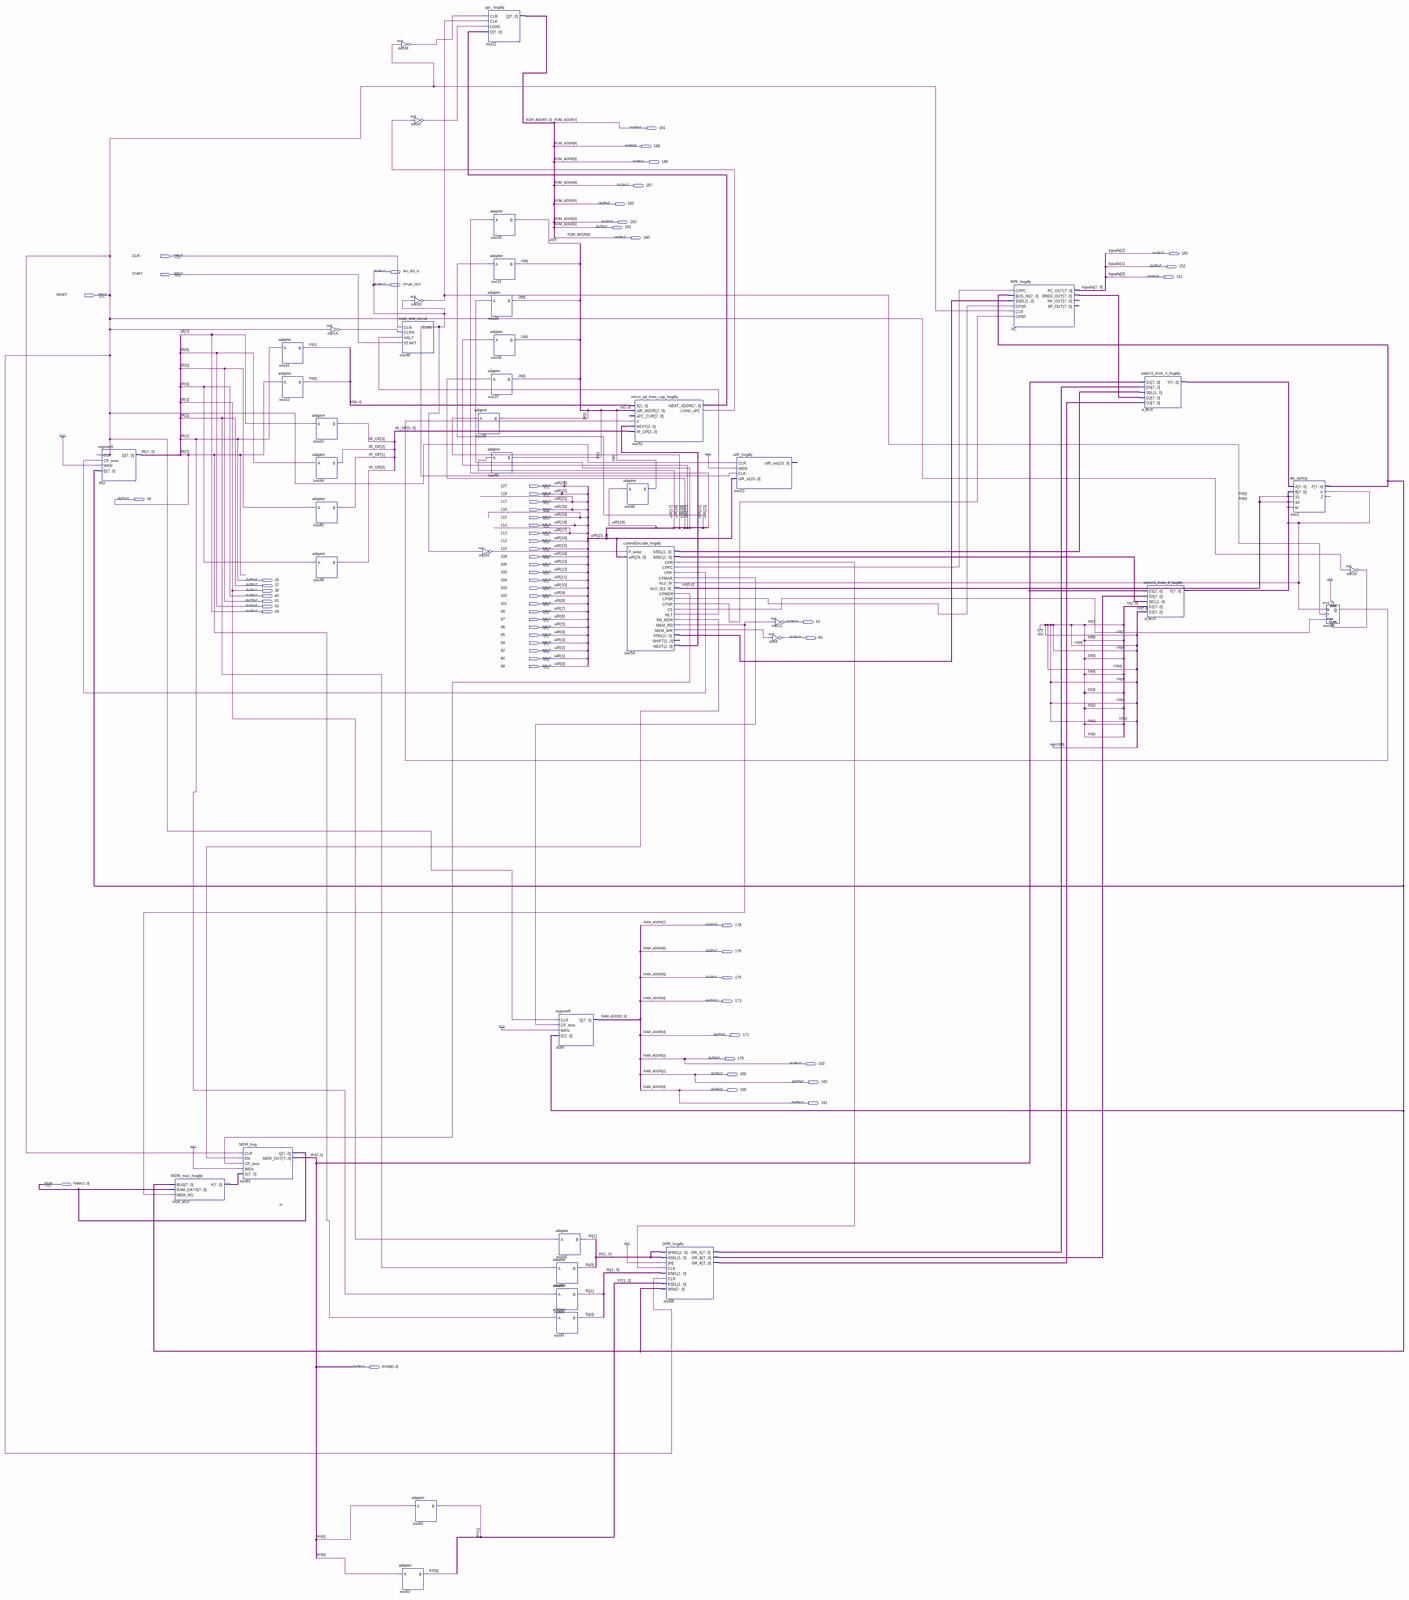
[diagram p0: schematic sheet, whole]
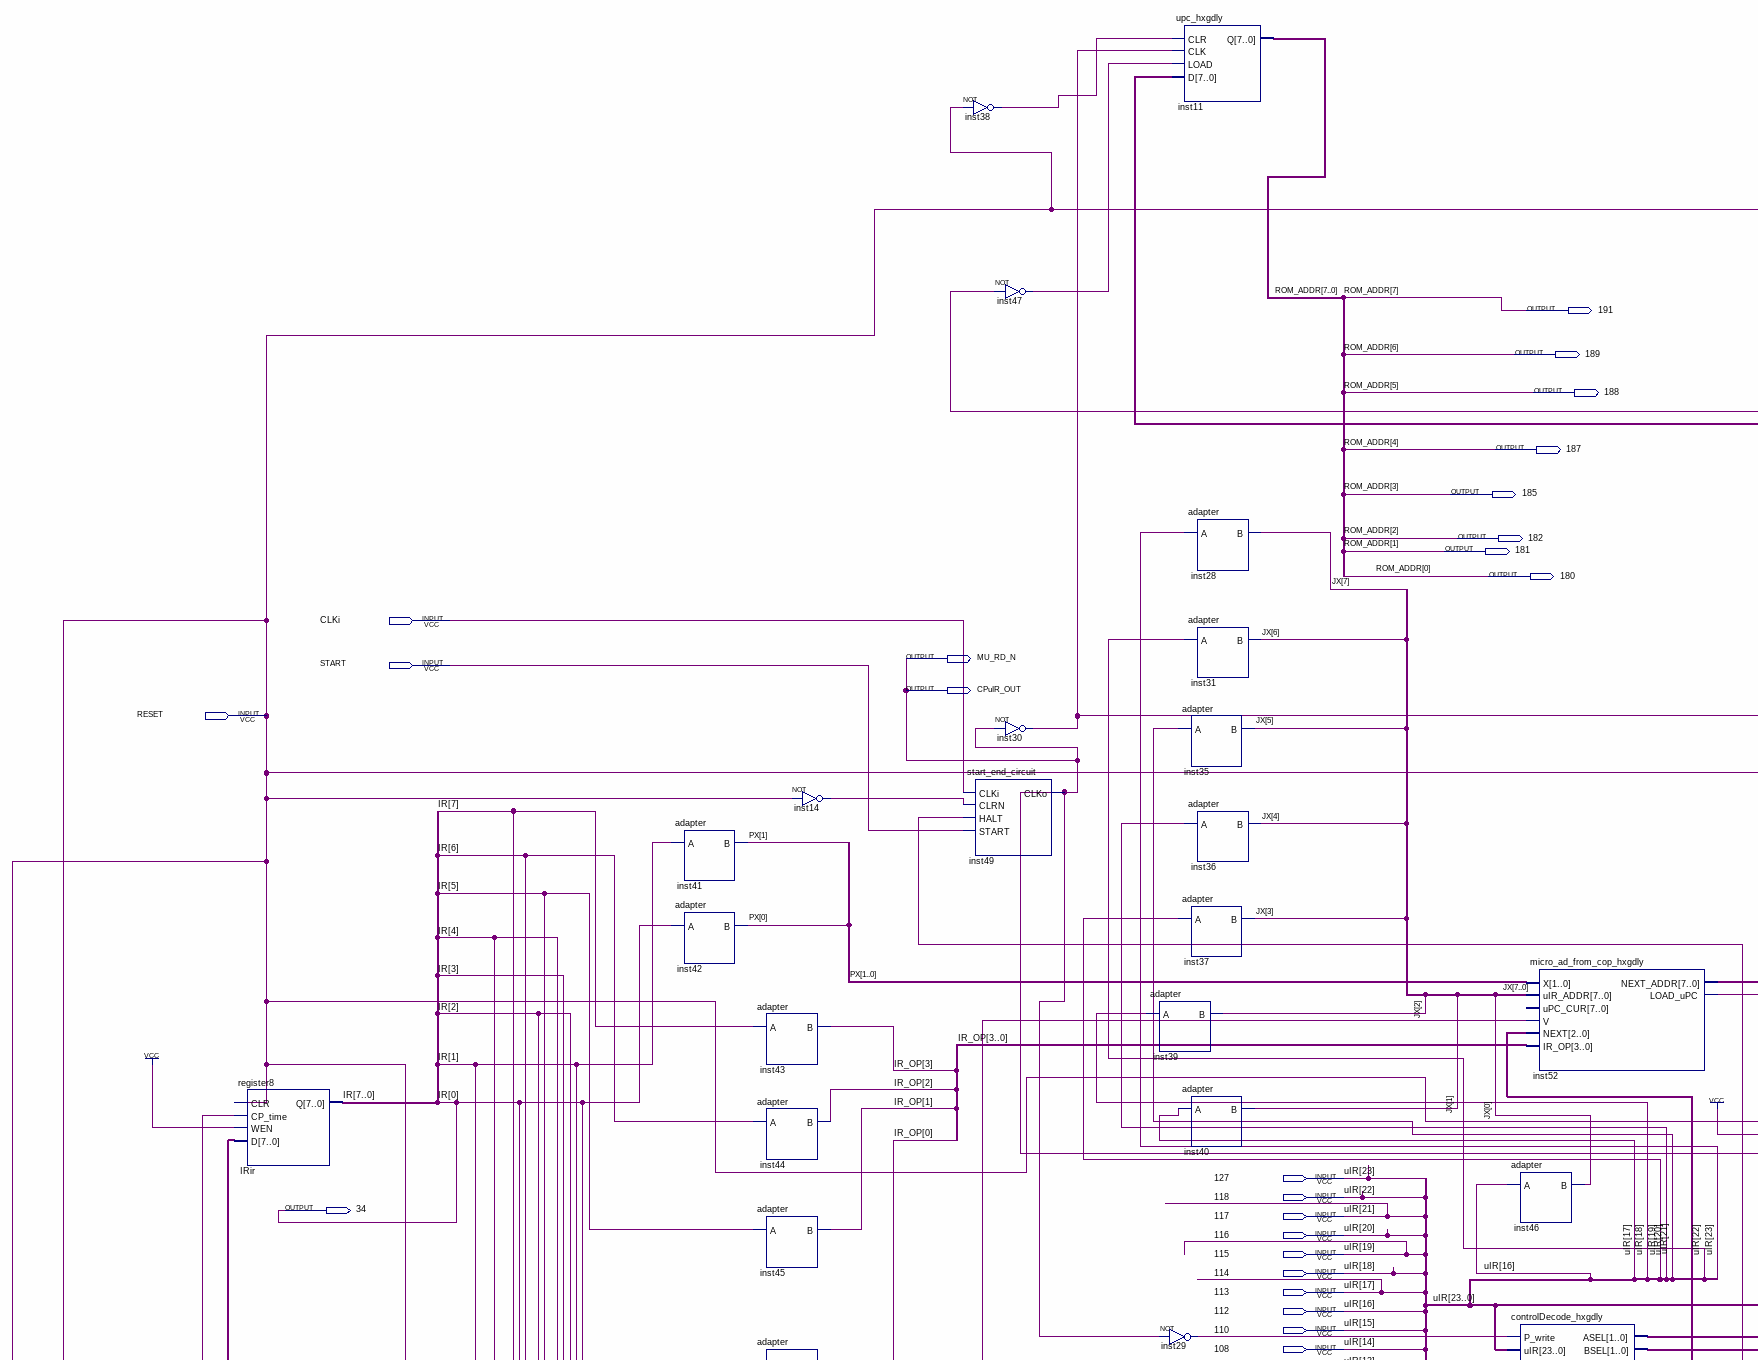
[diagram p1: schematic sheet, upper left part]
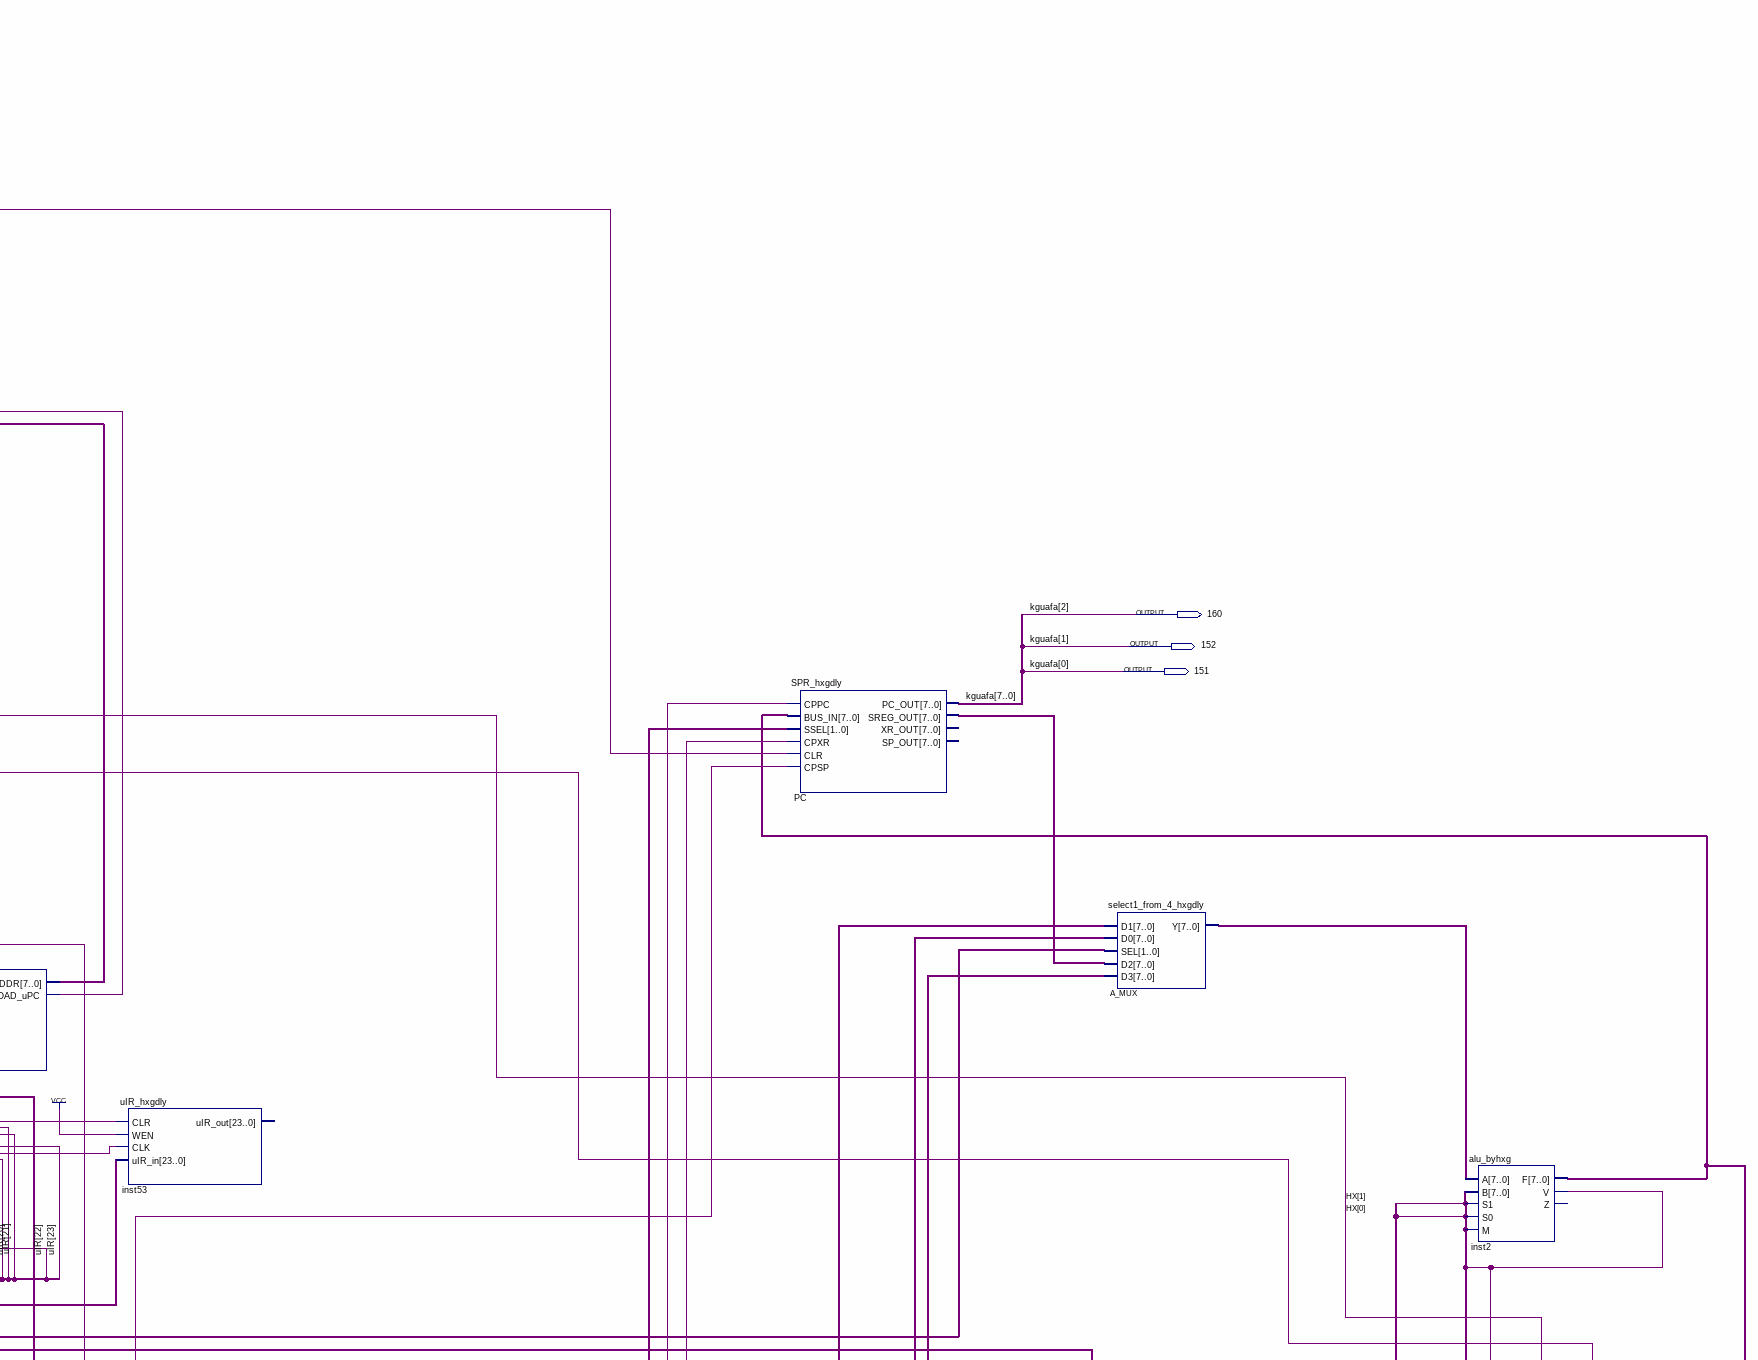
[diagram p2: schematic sheet, upper right part]
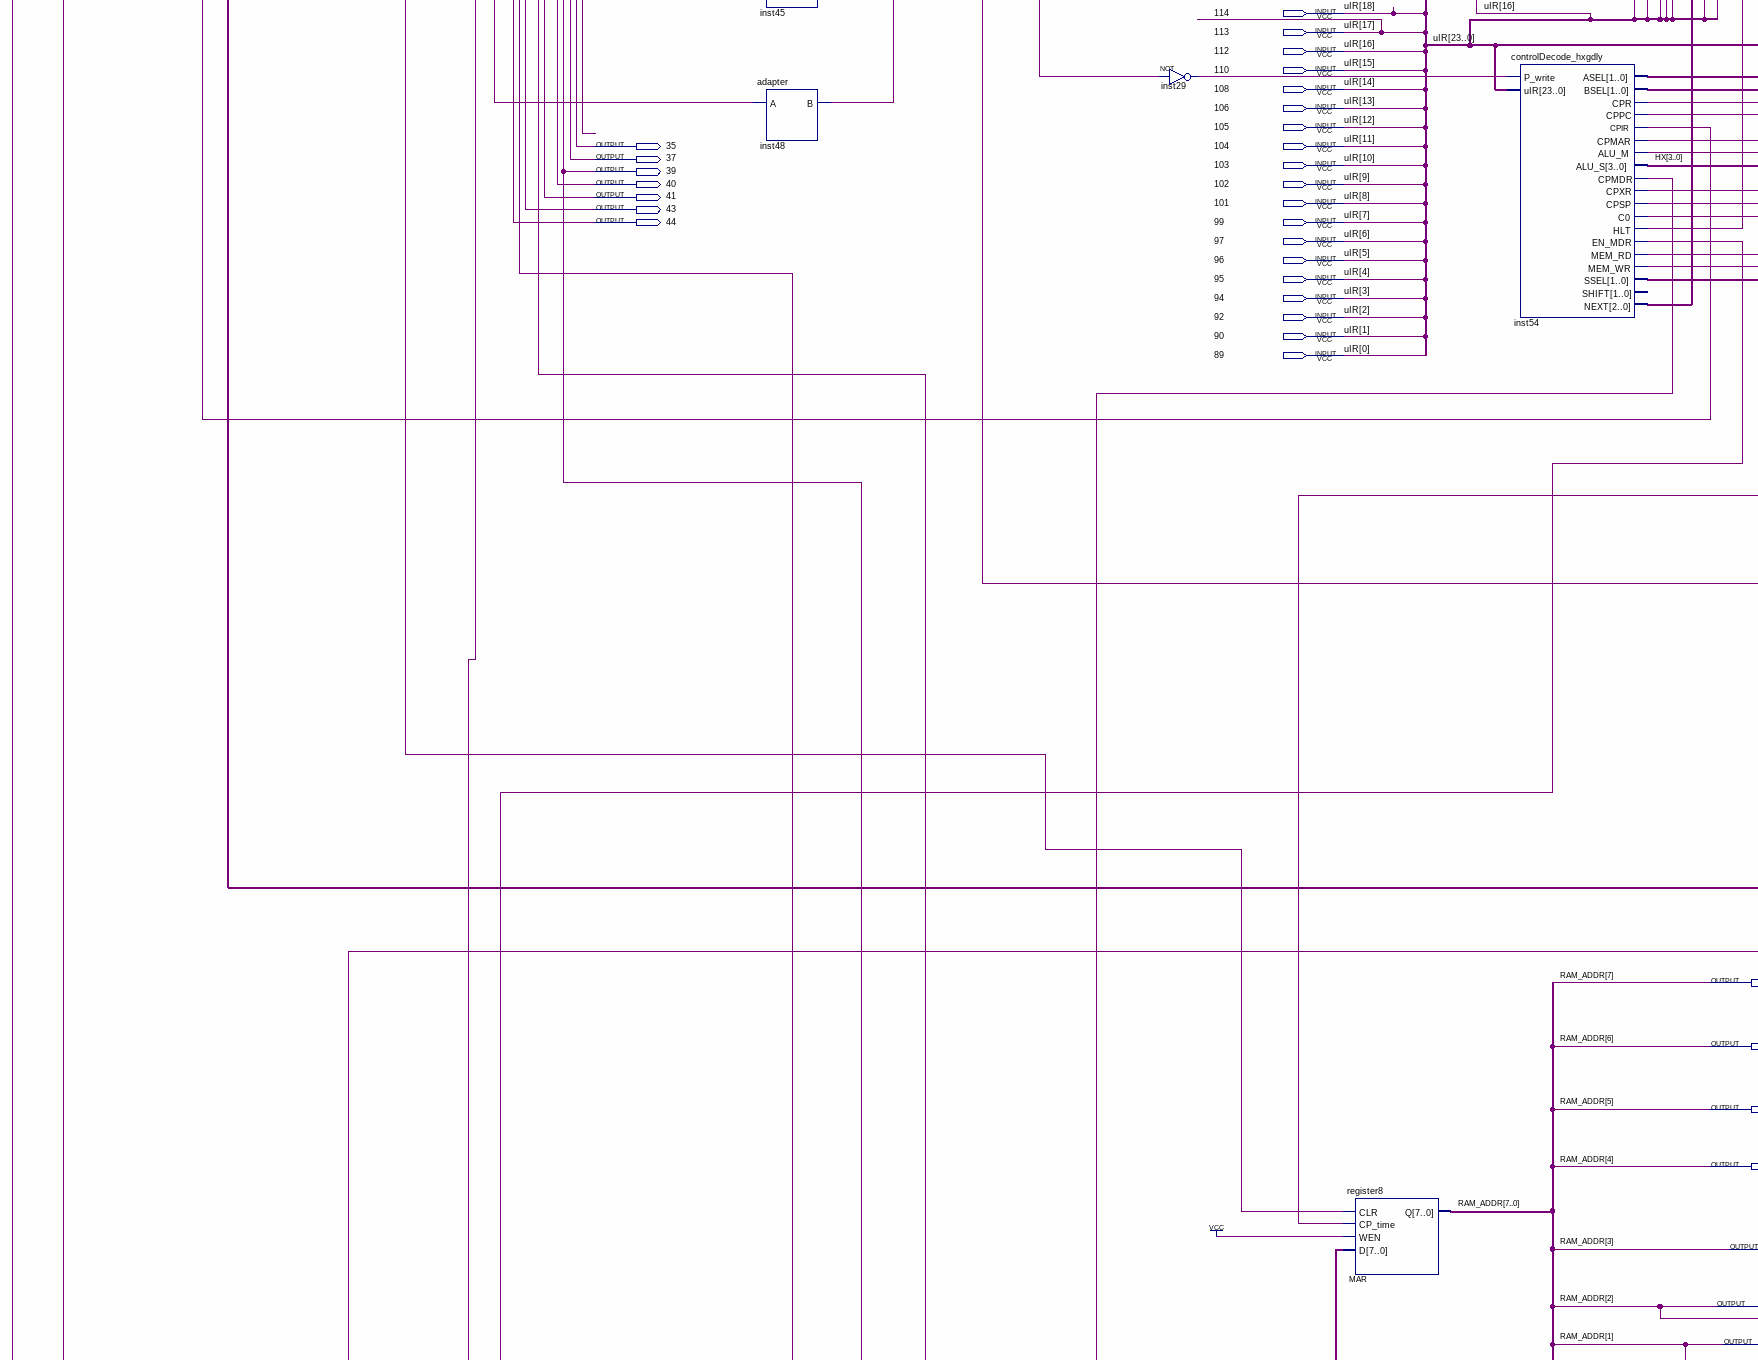
[diagram p3: schematic sheet, middle left part]
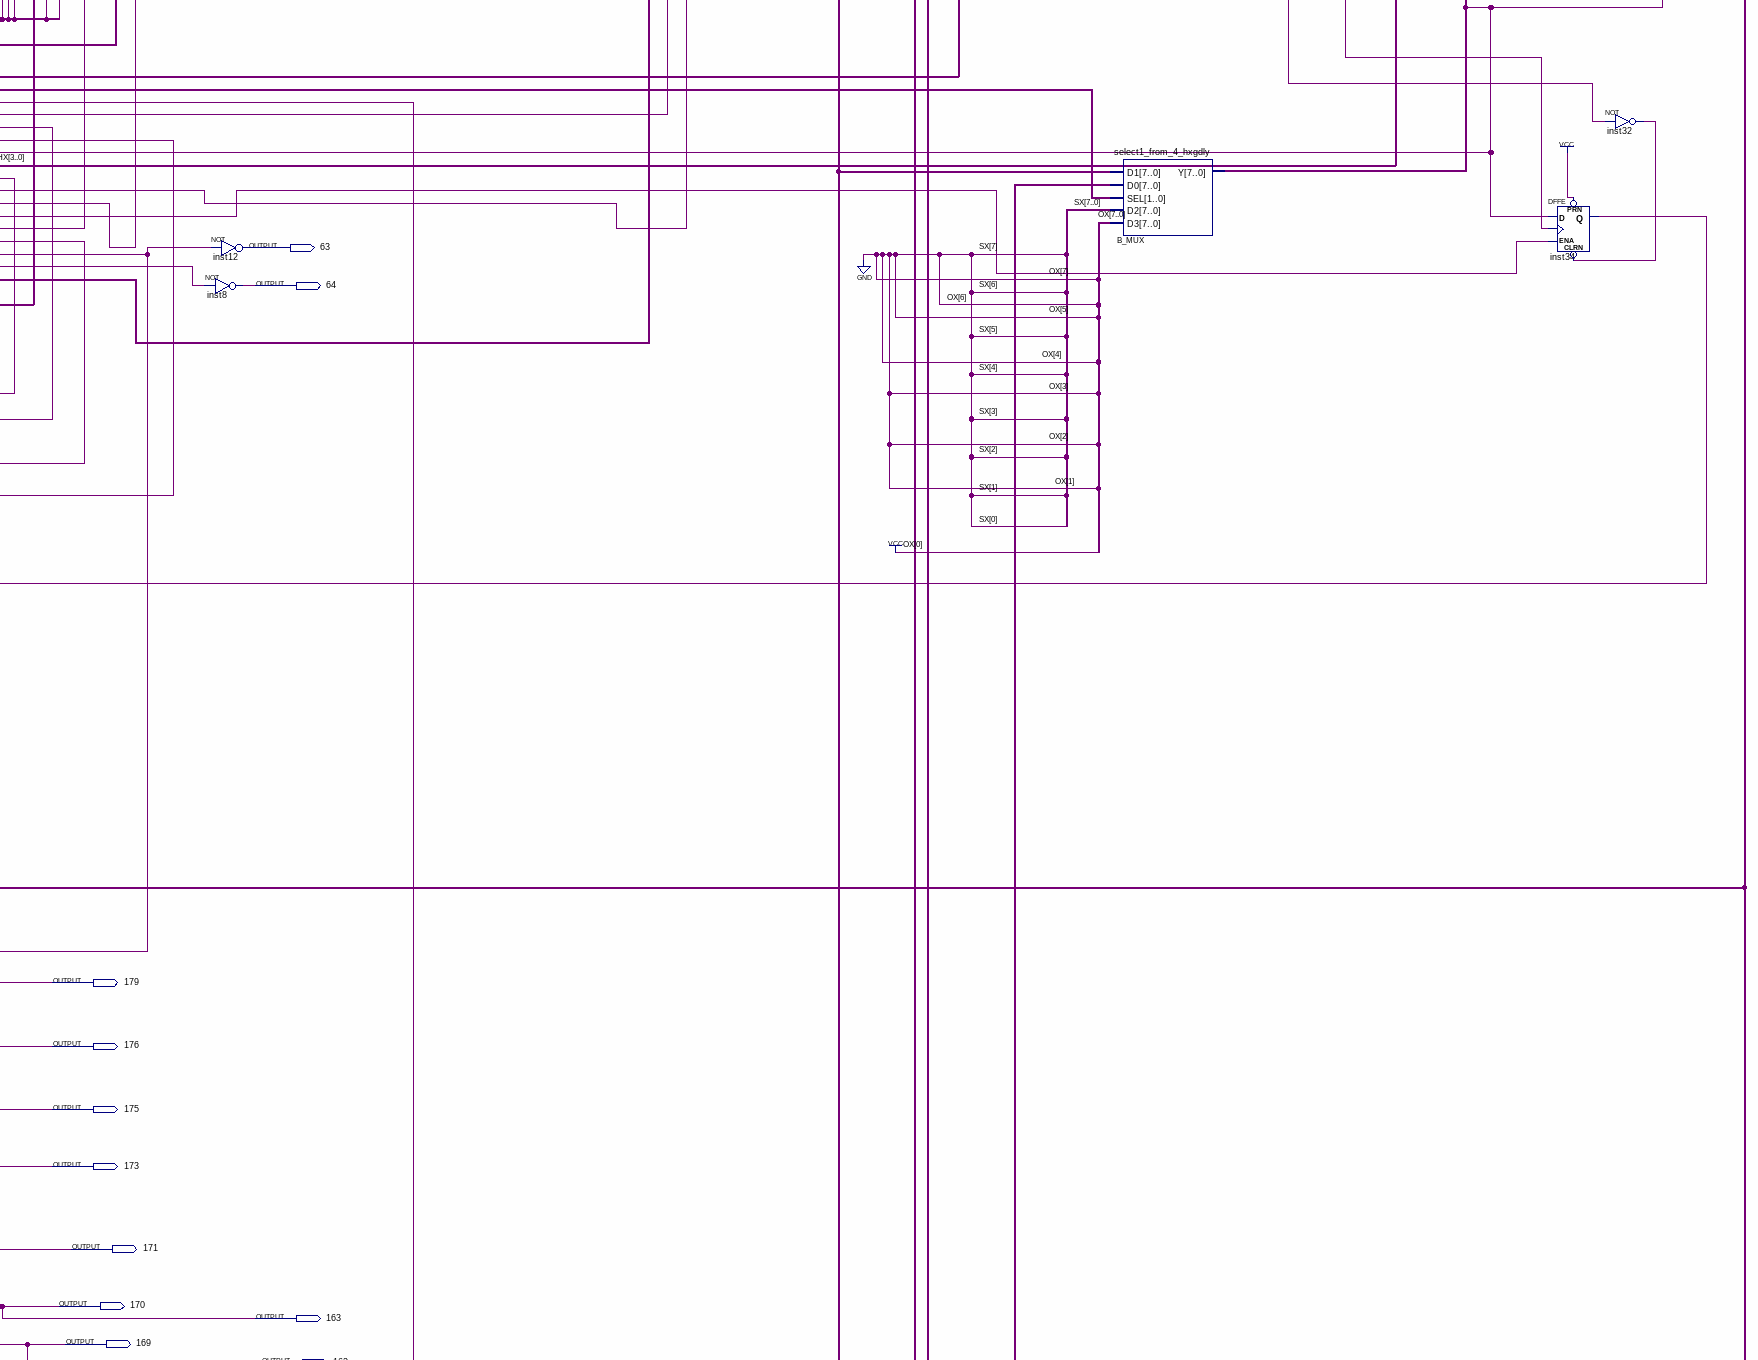
[diagram p4: schematic sheet, middle right part]
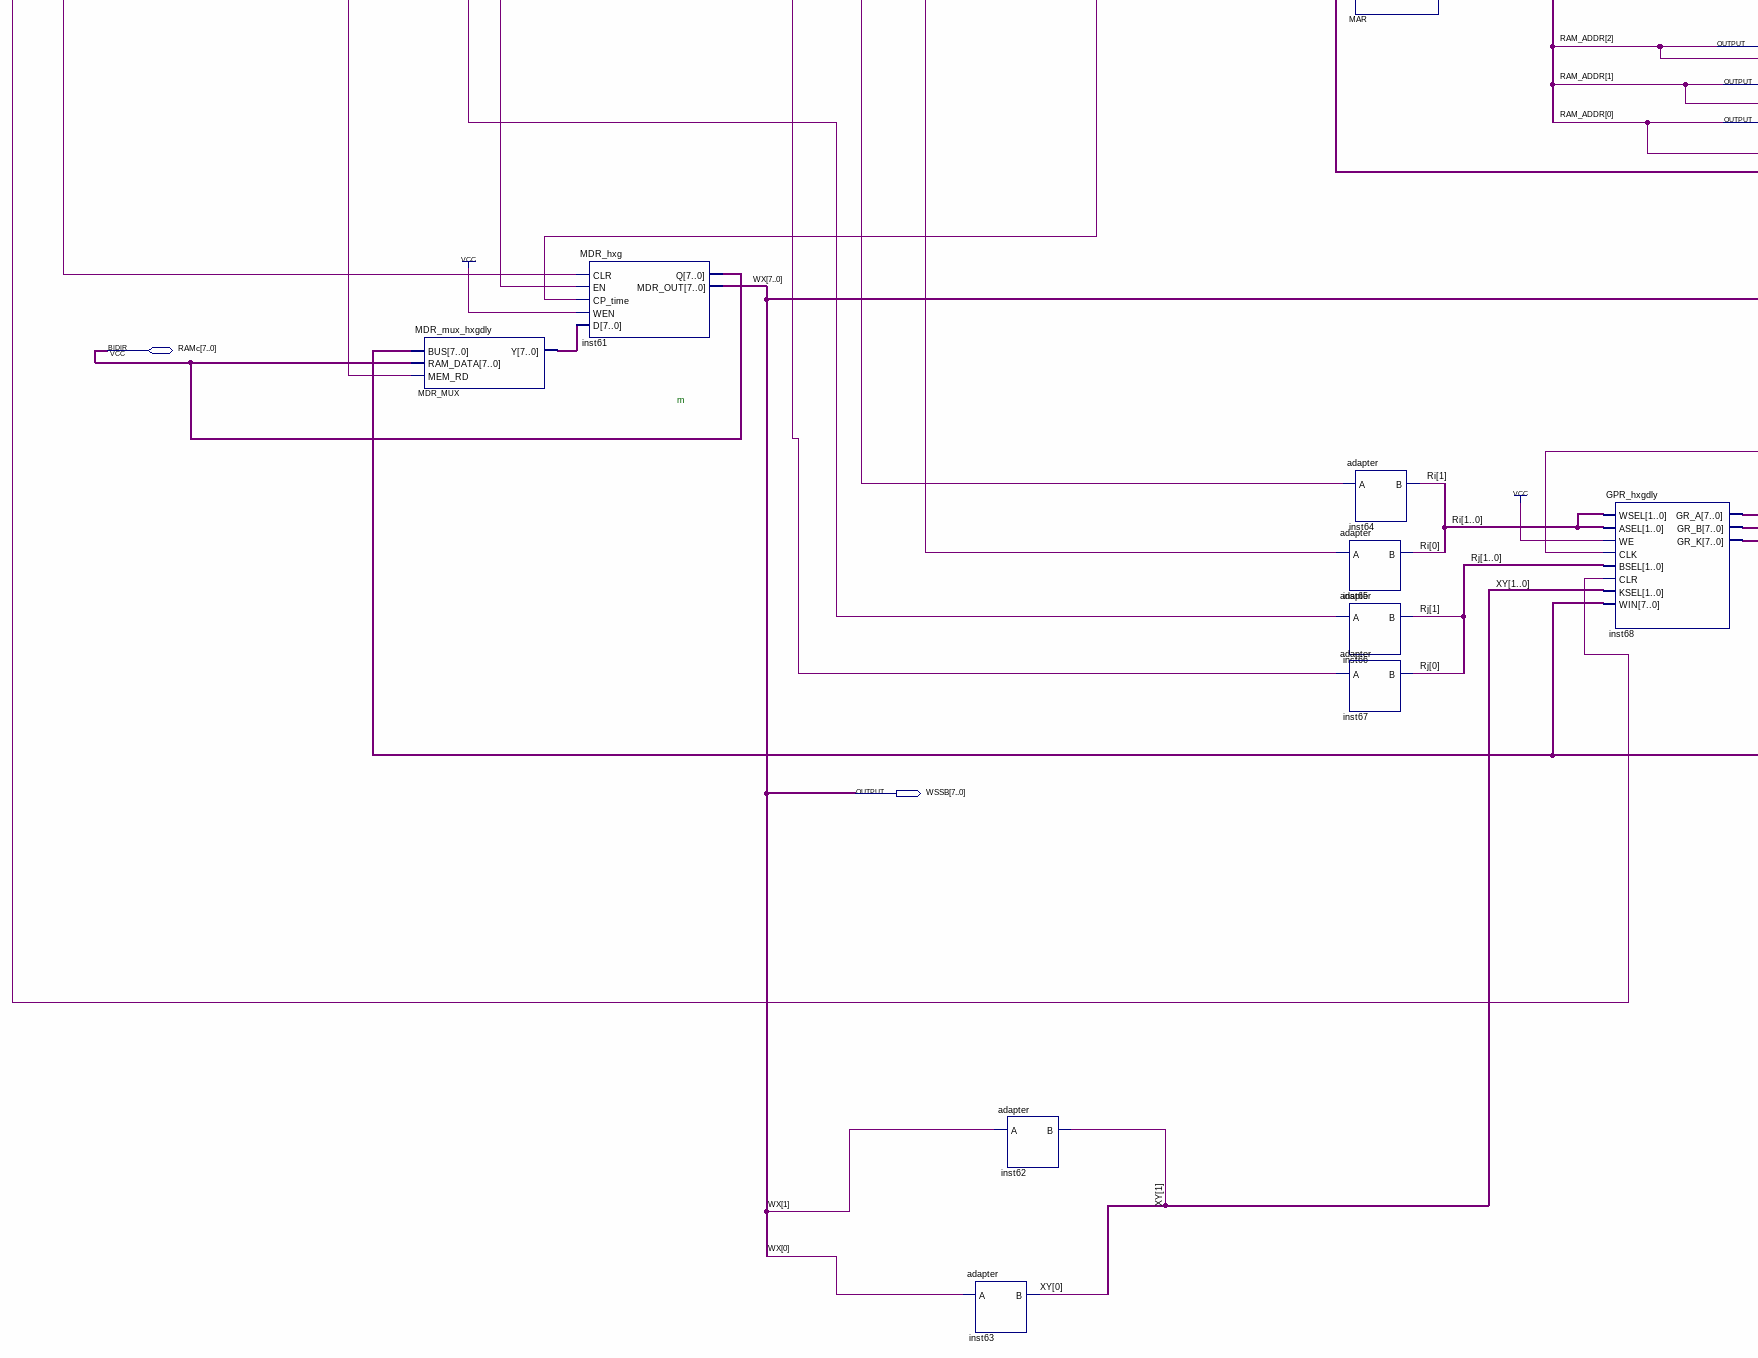
[diagram p5: schematic sheet, lower left part]
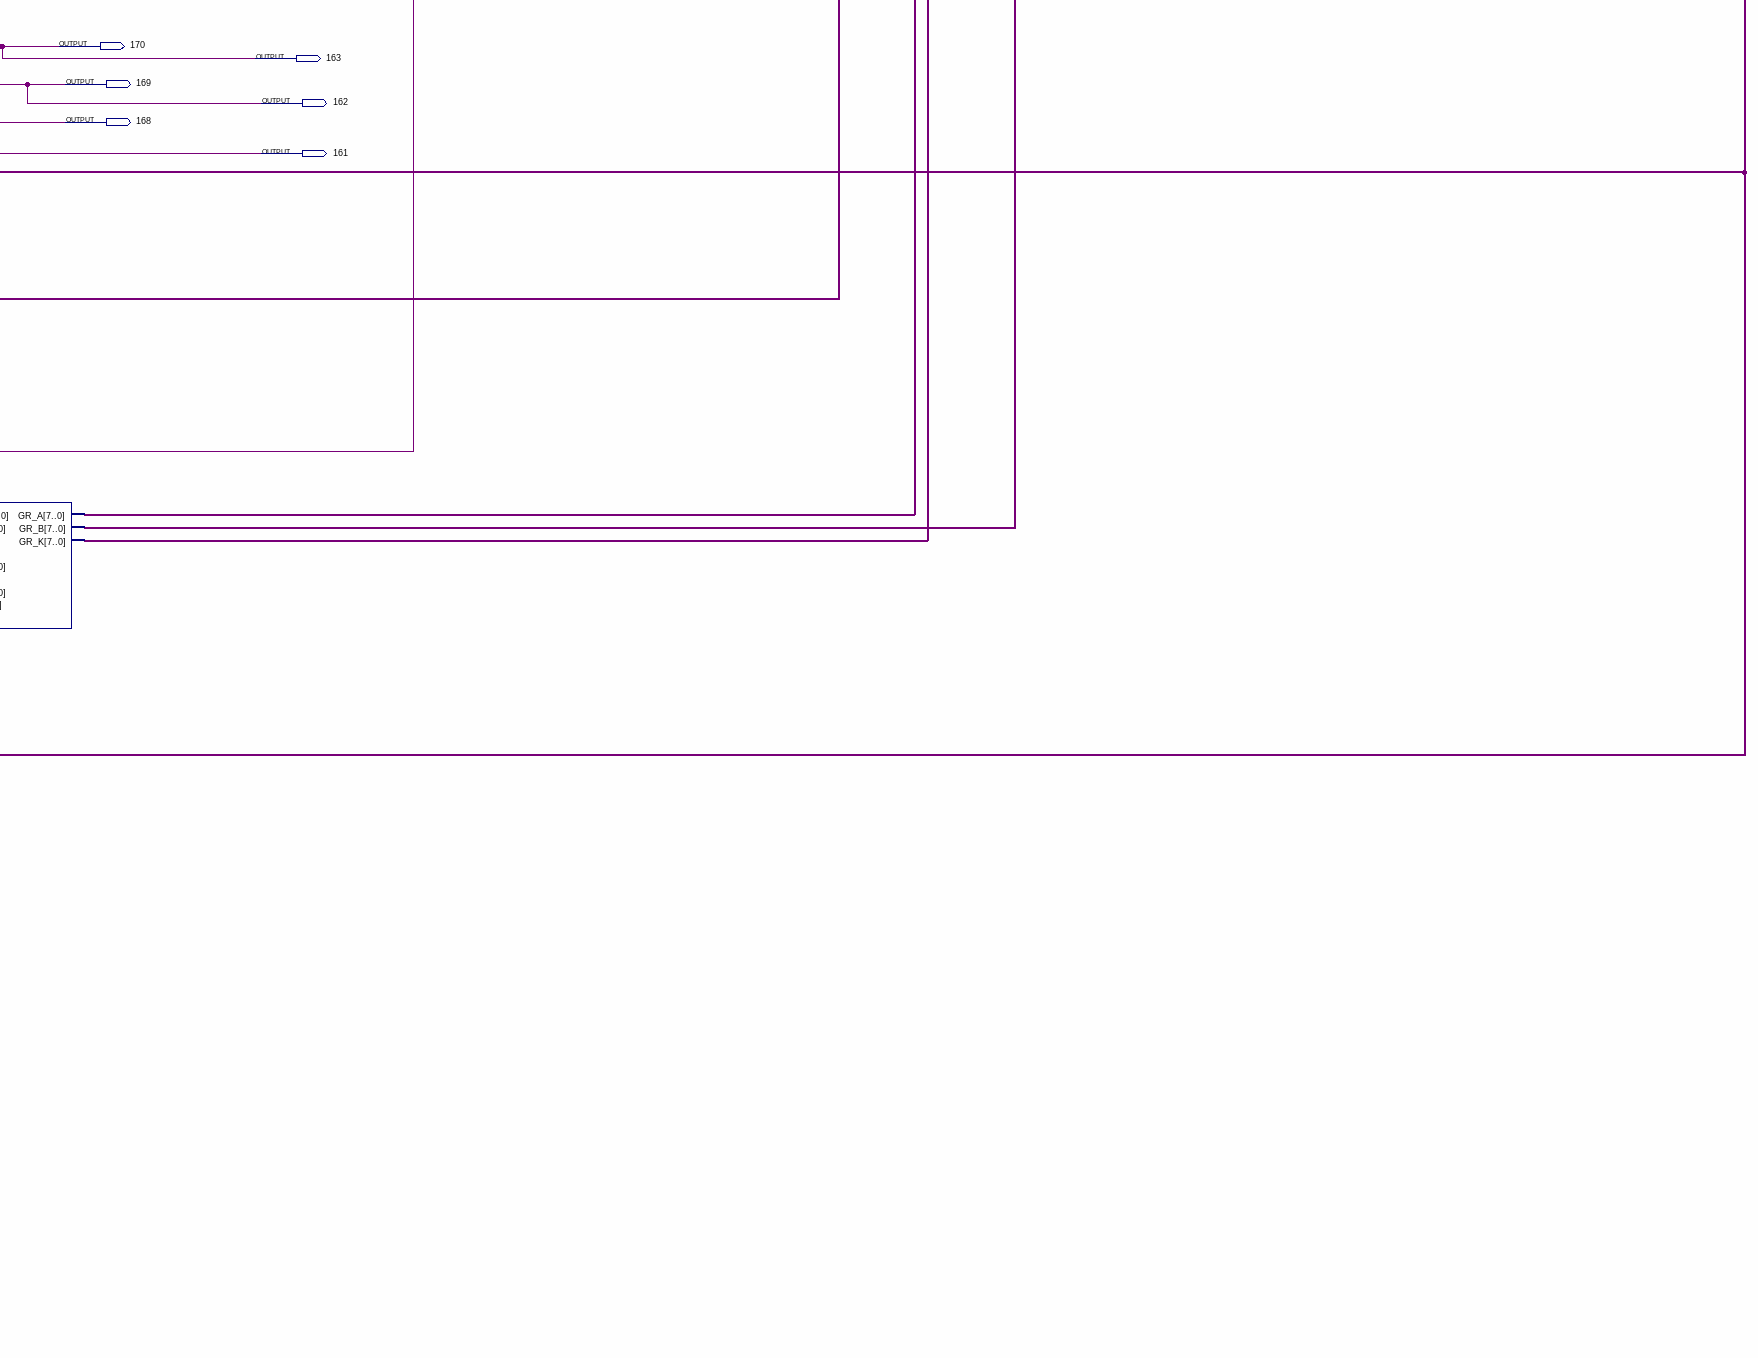
[diagram p6: schematic sheet, lower right part]
// Quartus schematic exp_final_hxgdly.bdf as structural Verilog: 43 symbols, 63 pins
module exp_final_hxgdly (
  input  CLKi,
  input  START,
  input  RESET,
  input  \127 ,
  input  \118 ,
  input  \117 ,
  input  \116 ,
  input  \115 ,
  input  \114 ,
  input  \113 ,
  input  \112 ,
  input  \110 ,
  input  \108 ,
  input  \106 ,
  input  \105 ,
  input  \104 ,
  input  \103 ,
  input  \102 ,
  input  \101 ,
  input  \99 ,
  input  \97 ,
  input  \96 ,
  input  \95 ,
  input  \94 ,
  input  \92 ,
  input  \90 ,
  input  \89 ,
  inout  [7:0] RAMc,
  output \191 ,
  output \189 ,
  output \188 ,
  output \187 ,
  output \185 ,
  output \182 ,
  output \181 ,
  output \180 ,
  output \160 ,
  output \152 ,
  output MU_RD_N,
  output \151 ,
  output CPuIR_OUT,
  output \34 ,
  output \35 ,
  output \37 ,
  output \39 ,
  output \40 ,
  output \41 ,
  output \43 ,
  output \44 ,
  output \63 ,
  output \64 ,
  output \179 ,
  output \176 ,
  output \175 ,
  output \173 ,
  output \171 ,
  output \170 ,
  output \163 ,
  output \169 ,
  output \162 ,
  output \168 ,
  output \161 ,
  output [7:0] WSSB
);

  wire inst14_out, inst29_out, inst30_out, inst32_out, inst34_q, inst38_out, inst47_out, inst52_load_upc,
       inst54_alu_m, inst54_c0, inst54_cpir, inst54_cpmar, inst54_cpmdr, inst54_cppc, inst54_cpr,
       inst54_cpsp, inst54_cpxr, inst54_en_mdr, inst54_hlt, inst54_mem_rd, inst54_mem_wr;
  wire [1:0] inst54_asel, inst54_bsel, inst54_ssel, PX, Ri, Rj, XY;
  wire [2:0] inst54_next;
  wire [3:0] HX, IR_OP;
  wire [7:0] A_MUX_y, B_MUX_y, inst2_f, inst52_next_addr, inst68_gr_a, inst68_gr_b, inst68_gr_k, JX,
       MDR_MUX_y, PC_sreg_out;
  wire [7:3] kguafa;

  register8 IRir (
    .CLR(RESET), .CP_time(inst54_cpir), .WEN(1'b1), .D(inst2_f),
    .Q({\44 , \43 , \41 , \40 , \39 , \37 , \35 , \34 }));
  MDR_mux_hxgdly MDR_MUX (.BUS(inst2_f), .RAM_DATA(RAMc), .MEM_RD(inst54_mem_rd), .Y(MDR_MUX_y));
  MDR_hxg inst61 (
    .CLR(RESET), .EN(inst54_en_mdr), .CP_time(inst54_cpmdr), .WEN(1'b1), .D(MDR_MUX_y), .Q(RAMc),
    .MDR_OUT(WSSB));
  adapter inst41 (.A(\35 ), .B(PX[1]));
  adapter inst42 (.A(\34 ), .B(PX[0]));
  adapter inst43 (.A(\44 ), .B(IR_OP[3]));
  adapter inst44 (.A(\43 ), .B(IR_OP[2]));
  adapter inst45 (.A(\41 ), .B(IR_OP[1]));
  adapter inst48 (.A(\40 ), .B(IR_OP[0]));
  not inst14 (inst14_out, RESET);
  not inst38 (inst38_out, RESET);
  start_end_circuit inst49 (.CLKi(CLKi), .CLRN(inst14_out), .HALT(inst54_hlt), .START(START), .CLKo(CPuIR_OUT));
  adapter inst63 (.A(WSSB[0]), .B(XY[0]));
  not inst47 (inst47_out, inst52_load_upc);
  not inst30 (inst30_out, CPuIR_OUT);
  adapter inst62 (.A(WSSB[1]), .B(XY[1]));
  upc_hxgdly inst11 (
    .CLR(inst38_out), .CLK(inst30_out), .LOAD(inst47_out), .D(inst52_next_addr),
    .Q({\191 , \189 , \188 , \187 , \185 , \182 , \181 , \180 }));
  adapter inst28 (.A(\127 ), .B(JX[7]));
  adapter inst31 (.A(\118 ), .B(JX[6]));
  adapter inst35 (.A(\117 ), .B(JX[5]));
  adapter inst36 (.A(\116 ), .B(JX[4]));
  adapter inst37 (.A(\115 ), .B(JX[3]));
  adapter inst39 (.A(\114 ), .B(JX[2]));
  adapter inst40 (.A(\113 ), .B(JX[1]));
  not inst29 (inst29_out, CPuIR_OUT);
  register8 MAR (
    .CLR(RESET), .CP_time(inst54_cpmar), .WEN(1'b1), .D(inst2_f),
    .Q({\179 , \176 , \175 , \173 , \171 , \163 , \162 , \161 }));
  adapter inst64 (.A(\39 ), .B(Ri[1]));
  adapter inst65 (.A(\37 ), .B(Ri[0]));
  adapter inst66 (.A(\35 ), .B(Rj[1]));
  adapter inst67 (.A(\34 ), .B(Rj[0]));
  micro_ad_from_cop_hxgdly inst52 (
    .X(PX), .uIR_ADDR(JX), .V(inst34_q), .NEXT(inst54_next), .IR_OP(IR_OP), .NEXT_ADDR(inst52_next_addr),
    .LOAD_uPC(inst52_load_upc));  // open: uPC_CUR
  adapter inst46 (.A(\112 ), .B(JX[0]));
  controlDecode_hxgdly inst54 (
    .P_write(inst29_out),
    .uIR({\127 , \118 , \117 , \116 , \115 , \114 , \113 , \112 , \110 , \108 , \106 , \105 , \104 , \103 , \102 , \101 , \99 , \97 , \96 , \95 , \94 , \92 , \90 , \89 }),
    .ASEL(inst54_asel), .BSEL(inst54_bsel), .CPR(inst54_cpr), .CPPC(inst54_cppc), .CPIR(inst54_cpir),
    .CPMAR(inst54_cpmar), .ALU_M(inst54_alu_m), .ALU_S(HX), .CPMDR(inst54_cpmdr), .CPXR(inst54_cpxr),
    .CPSP(inst54_cpsp), .C0(inst54_c0), .HLT(inst54_hlt), .EN_MDR(inst54_en_mdr), .MEM_RD(inst54_mem_rd),
    .MEM_WR(inst54_mem_wr), .SSEL(inst54_ssel), .NEXT(inst54_next));  // open: SHIFT
  GPR_hxgdly inst68 (
    .WSEL(Ri), .ASEL(Ri), .WE(1'b1), .CLK(inst54_cpr), .BSEL(Rj), .CLR(RESET), .KSEL(XY), .WIN(inst2_f),
    .GR_A(inst68_gr_a), .GR_B(inst68_gr_b), .GR_K(inst68_gr_k));
  uIR_hxgdly inst53 (
    .CLR(RESET), .WEN(1'b1), .CLK(CPuIR_OUT),
    .uIR_in({\127 , \118 , \117 , \116 , \115 , \114 , \113 , \112 , \110 , \108 , \106 , \105 , \104 , \103 , \102 , \101 , \99 , \97 , \96 , \95 , \94 , \92 , \90 , \89 }));  // open: uIR_out
  not inst12 (\63 , inst54_mem_rd);
  not inst8 (\64 , inst54_mem_wr);
  SPR_hxgdly PC (
    .CPPC(inst54_cppc), .BUS_IN(inst2_f), .SSEL(inst54_ssel), .CPXR(inst54_cpxr), .CLR(RESET),
    .CPSP(inst54_cpsp), .PC_OUT({kguafa, \160 , \152 , \151 }), .SREG_OUT(PC_sreg_out));  // open: XR_OUT, SP_OUT
  select1_from_4_hxgdly A_MUX (
    .D1(WSSB), .D0(inst68_gr_a), .SEL(inst54_asel), .D2(PC_sreg_out), .D3(inst68_gr_k), .Y(A_MUX_y));
  select1_from_4_hxgdly B_MUX (
    .D1(WSSB), .D0(inst68_gr_b), .SEL(inst54_bsel), .D2({8{1'b0}}), .D3(8'b00000001), .Y(B_MUX_y));
  alu_byhxg inst2 (
    .A(A_MUX_y), .B(B_MUX_y), .S1(B_MUX_y), .S0(B_MUX_y), .M(B_MUX_y), .F(inst2_f), .V(inst54_alu_m));  // open: Z
  DFFE inst34 (.PRN(1'b1), .CLRN(inst32_out), .D(inst54_alu_m), .CLK(inst30_out), .ENA(inst54_c0), .Q(inst34_q));
  not inst32 (inst32_out, RESET);

  assign \168  = \161 ;
  assign \169  = \162 ;
  assign \170  = \163 ;
  assign MU_RD_N = CPuIR_OUT;

  // Other names for the same wires on the sheet: IR[7:0] = {\44 , \43 , \41 , \40 , \39 , \37 , \35 , \34 };
  //   RAM_ADDR[7:0] = {\179 , \176 , \175 , \173 , \171 , \163 , \162 , \161 }; kguafa[2:0] = {\160 , \152 , \151 };
  //   ROM_ADDR[7:0] = {\191 , \189 , \188 , \187 , \185 , \182 , \181 , \180 };
  //   uIR[23:0] = {\127 , \118 , \117 , \116 , \115 , \114 , \113 , \112 , \110 , \108 , \106 , \105 , \104 , \103 , \102 , \101 , \99 , \97 , \96 , \95 , \94 , \92 , \90 , \89 };
  //   WX[7:0] = WSSB

  // Notes on the sheet:
  //   m
endmodule
